# Altium schematic sheet 02.Power_Uint.SchDoc: 02.Power_Uint
size A4; Organization: Altium Limited; Address1: L3, 12a Rodborough Rd; Address2: Frenchs Forest; Address3: NSW; Address4: Australia 2086; Revision: V1; SheetNumber: 3; SheetTotal: 6; Project: STC16F40K128
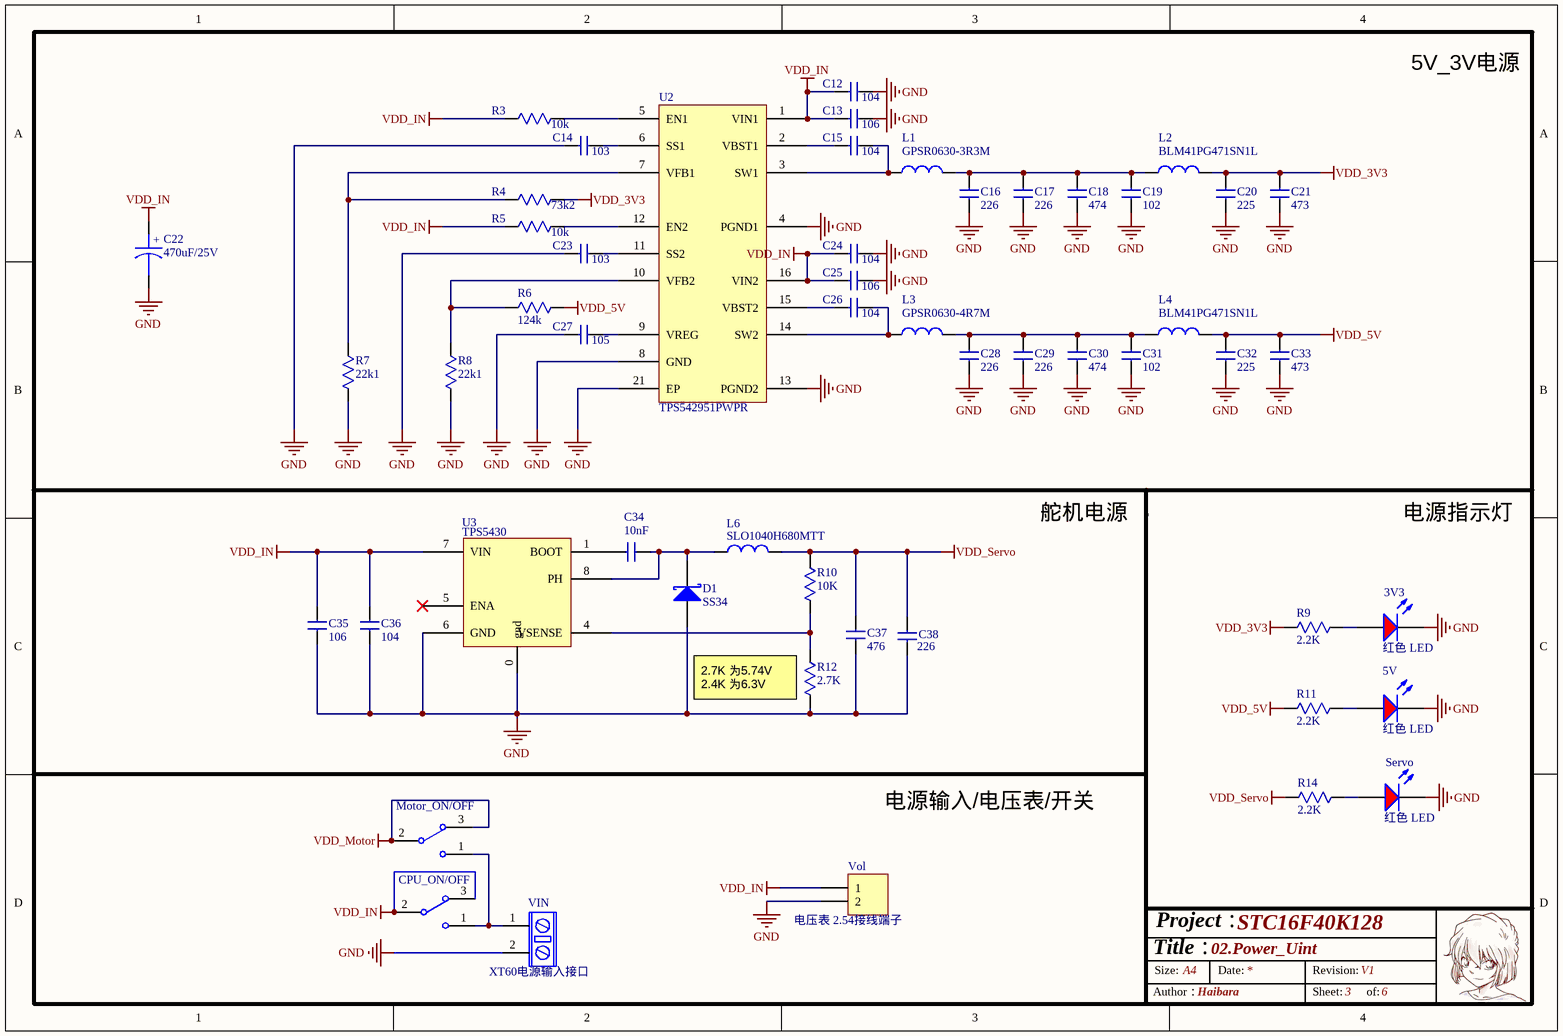
[diagram p0: 02.Power_Uint.SchDoc]

## Parts
3V3  红色 LED  [0603 LED R]
5V  红色 LED  [0603 LED R]
C12  104  [C0603]
C13  106  [C0805]
C14  103  [C0603]
C15  104  [C0805]
C16  226  [C0805]
C17  226  [C0805]
C18  474  [C0603]
C19  102  [C0603]
C20  225  [C0603]
C21  473  [C0603]
C22  470uF/25V  [CAP 2.5*6.3*11.2]
C23  103  [C0603]
C24  104  [C0603]
C25  106  [C0805]
C26  104  [C0805]
C27  105  [C0603]
C28  226  [C0805]
C29  226  [C0805]
C30  474  [C0603]
C31  102  [C0603]
C32  225  [C0603]
C33  473  [C0603]
C34  10nF  [C0603]
C35  106  [C0805]
C36  104  [C0603]
C37  476  [C0805]
C38  226  [C0805]
CPU_ON/OFF  SW-SPDT  [MTS-102S 两档纽子开关]  (value not drawn)
D1  SS34  [SMA]
L1  GPSR0630-3R3M  [L 0630]
L2  BLM41PG471SN1L  [R1206]
L3  GPSR0630-4R7M  [L 0630]
L4  BLM41PG471SN1L  [R1206]
L6  SLO1040H680MTT  [IND-SMD_L10.8-W10.0]
Motor_ON/OFF  SW-SPDT  [MTS-102S 两档纽子开关]  (value not drawn)
R3  10k  [R0603]
R4  73k2  [R0603]
R5  10k  [R0603]
R6  124k  [R0603]
R7  22k1  [R0603]
R8  22k1  [R0603]
R9  2.2K  [R0603]
R10  10K  [R0603]
R11  2.2K  [R0603]
R12  2.7K  [R0603]
R14  2.2K  [R0603]
Servo  红色 LED  [0603 LED R]
U2  TPS542951PWPR  [SSOP16_EP]
U3  TPS5430  [LC-SOP-8_EP_150mil]
VIN  XT60电源输入接口  [XT60 母头 电源接口]
Vol  电压表 2.54接线端子  [XH2.54-LI-2P]

## Nets
GND: 3V3.2 5V.2 C12.2 C13.2 C14.1 C16.1 C17.1 C18.1 C19.1 C20.1 C21.1 C22.2 C23.1 C24.2 C25.2 C27.1 C28.1 C29.1 C30.1 C31.1 C32.1 C33.1 C35.1 C36.1 C37.1 C38.1 D1.1(A) R7.1 R8.1 R12.1 Servo.2 U2.4(PGND1) U2.8(GND) U2.13(PGND2) U2.21(EP) U3.0(gnd) U3.6(GND) VIN.2 Vol.2
VDD_3V3: C20.2 C21.2 L2.2 R4.1 R9.1
VDD_5V: C32.2 C33.2 L4.2 R6.1 R11.1
VDD_IN: C12.1 C13.1 C22.1 C24.1 C25.1 C35.2 C36.2 CPU_ON/OFF.2 CPU_ON/OFF.3 R3.2 R5.2 U2.1(VIN1) U2.16(VIN2) U3.7(VIN) Vol.1
VDD_Motor: Motor_ON/OFF.2 Motor_ON/OFF.3
VDD_Servo: C37.2 C38.2 L6.2 R10.2 R14.1
Net3V3_1: 3V3.1 R9.2
Net5V_1: 5V.1 R11.2
NetC14_2: C14.2 U2.6(SS1)
NetC15_1: C15.1 U2.2(VBST1)
NetC15_2: C15.2 L1.1 U2.3(SW1)
NetC16_2: C16.2 C17.2 C18.2 C19.2 L1.2 L2.1
NetC23_2: C23.2 U2.11(SS2)
NetC26_1: C26.1 U2.15(VBST2)
NetC26_2: C26.2 L3.1 U2.14(SW2)
NetC27_2: C27.2 U2.9(VREG)
NetC28_2: C28.2 C29.2 C30.2 C31.2 L3.2 L4.1
NetC34_1: C34.1 D1.2(K) L6.1 U3.8(PH)
NetC34_2: C34.2 U3.1(BOOT)
NetCPU_ON/OFF_1: CPU_ON/OFF.1 Motor_ON/OFF.1 VIN.1
NetR3_1: R3.1 U2.5(EN1)
NetR4_2: R4.2 R7.2 U2.7(VFB1)
NetR5_1: R5.1 U2.12(EN2)
NetR6_2: R6.2 R8.2 U2.10(VFB2)
NetR10_1: R10.1 R12.2 U3.4(VSENSE)
NetR14_2: R14.2 Servo.1

Not connected (* = marked no-connect by the designer): U3 5(ENA)*

## Notes on the sheet
- (near R12) 2.7K 为5.74V
  2.4K 为6.3V
- Labels drawn without touching a wire or pin: 5V_3V电源, 电源指示灯, 电源输入/电压表/开关, 舵机电源
- Title：
- Size:
- Project：
- A4
- Date:
- Revision:
- Author：
- Haibara
- Sheet:
- of:
- (in symbol CAP POL) +

## Library data of the parts
3V3 5V Servo = 红灯: 发光二极管; ComponentLink1Description: 供应商链接; ComponentLink1URL: http://www.szlcsc.com/product/details_2668.html; Package: 0805; Supplier: LC; SuppliersPartNumber: C2295
C12-C21 C23-C38 = 电容
C22 = CAP POL: Capacitor
CPU_ON/OFF Motor_ON/OFF = SW-SPDT: SPDT Subminiature Toggle Switch, Right Angle Mounting, Vertical Actuation; Published: 24-Mar-1999; LatestRevisionDate: 17-Dec-2003; LatestRevisionNote: Schematic revised, PCB Footprint replaced.; DatasheetVersion: 05-Dec-2000; PackageReference: TL36WW15050; Publisher: Altium Limited; PackageDescription: Switch; 4 Leads; ComponentLink1Description: Manufacturer Link; ComponentLink1URL: http://www.apem.com
D1 = 肖特基二极管: Schottky Rectifier; Note: Terminal 2 is the TAB and is electrically connected to the cathode; Published: 8-Jun-2000; LatestRevisionDate: 17-Jul-2002; LatestRevisionNote: Re-released for DXP Platform.; DatasheetVersion: PD-2.057B; PackageVersion: Feb-1998; PackageReference: TO-220AC; Publisher: Altium Limited; PackageDescription: TO, Thru-Hole, Vertical, Heatsink Mounted; 3 In-Line Leads (1 Absent); Pitch 2.54 mm; ComponentLink1Description: Manufacturer Link; ComponentLink1URL: http://www.irf.com/; ComponentLink2Description: Datasheet; ComponentLink2URL: http://www.irf.com/product-info/datasheets/data/10tq.pdf
L1 L3 L6 = 电感
L2 L4 = 磁珠: BLM18PG471SN1D
R3-R12 R14 = 电阻
U3 = TPS5410: 1-A, Wide Input Range, Step-Down Converter
VIN = 电机供电接口
Vol = Header 2: Header, 2-Pin; LatestRevisionDate: 17-Jul-2002; LatestRevisionNote: Re-released for DXP Platform.; Publisher: Altium Limited